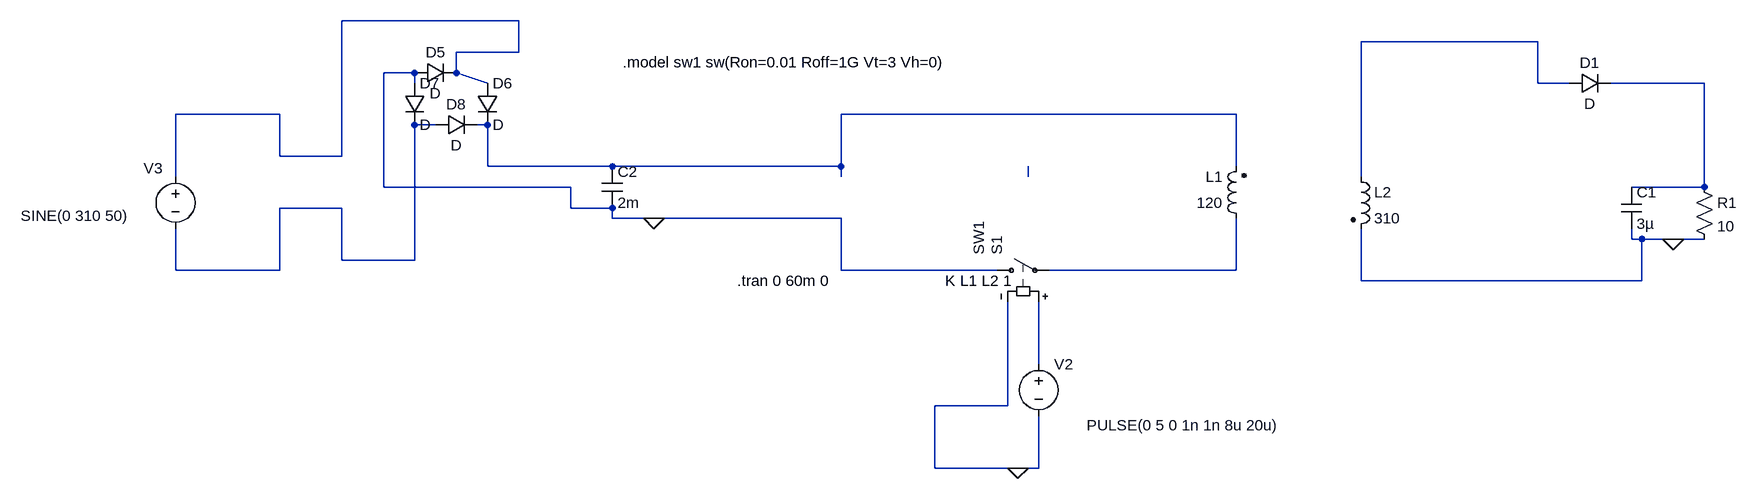
[diagram p0: schematic Draft2_21042022.asc]
Draft2_21042022.asc, the LTspice schematic file:
Version 4
SHEET 1 1128 680
WIRE -752 -112 -1024 -112
WIRE 816 -80 544 -80
WIRE -752 -64 -752 -112
WIRE -752 -64 -848 -64
WIRE -912 -32 -960 -32
WIRE -848 -32 -848 -64
WIRE -912 -16 -912 -32
WIRE -800 -16 -848 -32
WIRE 816 -16 816 -80
WIRE 864 -16 816 -16
WIRE 1072 -16 928 -16
WIRE -1120 32 -1280 32
WIRE 352 32 -256 32
WIRE -880 48 -912 48
WIRE -800 48 -816 48
WIRE -1120 96 -1120 32
WIRE -1024 96 -1024 -112
WIRE -1024 96 -1120 96
WIRE -800 112 -800 48
WIRE -608 112 -800 112
WIRE -256 112 -256 32
WIRE -256 112 -608 112
WIRE 352 112 352 32
WIRE -1280 128 -1280 32
WIRE -256 128 -256 112
WIRE 32 128 32 112
WIRE 544 128 544 -80
WIRE -960 144 -960 -32
WIRE -672 144 -960 144
WIRE 1072 144 1072 -16
WIRE 1072 144 960 144
WIRE -1024 176 -1120 176
WIRE -672 176 -672 144
WIRE -608 176 -672 176
WIRE -608 192 -608 176
WIRE -544 192 -608 192
WIRE -256 192 -544 192
WIRE 960 224 960 208
WIRE 976 224 960 224
WIRE 1024 224 976 224
WIRE 1072 224 1024 224
WIRE -1024 256 -1024 176
WIRE -912 256 -912 48
WIRE -912 256 -1024 256
WIRE -1280 272 -1280 208
WIRE -1120 272 -1120 176
WIRE -1120 272 -1280 272
WIRE -256 272 -256 192
WIRE -16 272 -256 272
WIRE 352 272 352 192
WIRE 352 272 64 272
WIRE 544 288 544 208
WIRE 976 288 976 224
WIRE 976 288 544 288
WIRE 48 416 48 320
WIRE 0 480 0 320
WIRE 0 480 -112 480
WIRE -112 576 -112 480
WIRE 16 576 -112 576
WIRE 48 576 48 496
WIRE 48 576 16 576
FLAG 1024 224 0
FLAG 16 576 0
FLAG -544 192 0
SYMBOL ind2 368 208 R180
WINDOW 0 36 80 Left 2
WINDOW 3 36 40 Left 2
SYMATTR InstName L1
SYMATTR Value 120
SYMATTR Type ind
SYMBOL ind2 528 112 R0
SYMATTR InstName L2
SYMATTR Value 310
SYMATTR Type ind
SYMBOL cap 944 144 R0
SYMATTR InstName C1
SYMATTR Value 3µ
SYMBOL res 1056 128 R0
SYMATTR InstName R1
SYMATTR Value 10
SYMBOL sw -32 272 R270
WINDOW 3 24 -12 Left 2
SYMATTR Value SW1
SYMATTR InstName S1
SYMBOL voltage 48 400 R0
WINDOW 123 0 0 Left 0
WINDOW 39 0 0 Left 0
WINDOW 3 74 110 Left 2
SYMATTR Value PULSE(0 5 0 1n 1n 8u 20u)
SYMATTR InstName V2
SYMBOL diode -912 -16 R270
WINDOW 0 32 32 VTop 2
WINDOW 3 0 32 VBottom 2
SYMATTR InstName D5
SYMBOL diode -816 -16 R0
SYMATTR InstName D6
SYMBOL cap -624 112 R0
SYMATTR InstName C2
SYMATTR Value 2m
SYMBOL voltage -1280 112 R0
WINDOW 0 -49 3 Left 2
WINDOW 3 -238 76 Left 2
WINDOW 123 0 0 Left 0
WINDOW 39 -247 121 Left 2
SYMATTR InstName V3
SYMATTR Value SINE(0 310 50)
SYMBOL diode -928 -16 R0
SYMATTR InstName D7
SYMBOL diode -880 64 R270
WINDOW 0 32 32 VTop 2
WINDOW 3 0 32 VBottom 2
SYMATTR InstName D8
SYMBOL diode 864 0 R270
WINDOW 0 32 32 VTop 2
WINDOW 3 0 32 VBottom 2
SYMATTR InstName D1
TEXT -416 288 Left 2 !.tran 0 60m 0
TEXT -96 288 Left 2 !K L1 L2 1
TEXT -592 -48 Left 2 !.model sw1 sw(Ron=0.01 Roff=1G Vt=3 Vh=0)

The netlist it stands for:
* Draft2_21042022.asc
L1 N007 N004 120
L2 N002 0 310
C1 N003 0 3µ
R1 N003 0 10
S1 0 N007 N008 0 SW1
V2 N008 0 PULSE(0 5 0 1n 1n 8u 20u)
D5 0 N001 D
D6 N001 N004 D
C2 N004 0 2m
V3 N001 N005 SINE(0 310 50)
D7 0 N005 D
D8 N005 N004 D
D1 N002 N003 D
.model D D
.lib standard.dio
.tran 0 60m 0
K L1 L2 1
.model sw1 sw(Ron=0.01 Roff=1G Vt=3 Vh=0)
.backanno
.end